# EasyEDA Pro project alcometer_v3.epro

# Schematic ESP32 Tutorial
Board Name: ESP32 Tutorial; Create Date: 2025-11-22; Page Name: Schematic; Project Name: ESP32_Alcometer_2.0; Schematic Name: ESP32 Tutorial; Update Date: 2026-02-11; Add into BOM: yes; Company: FEDEVEL; Convert to PCB: yes; Date: 2022-10-17; Draw By: robertferanec; REV: 1.0; Sheet: 1/1; spicePre: .
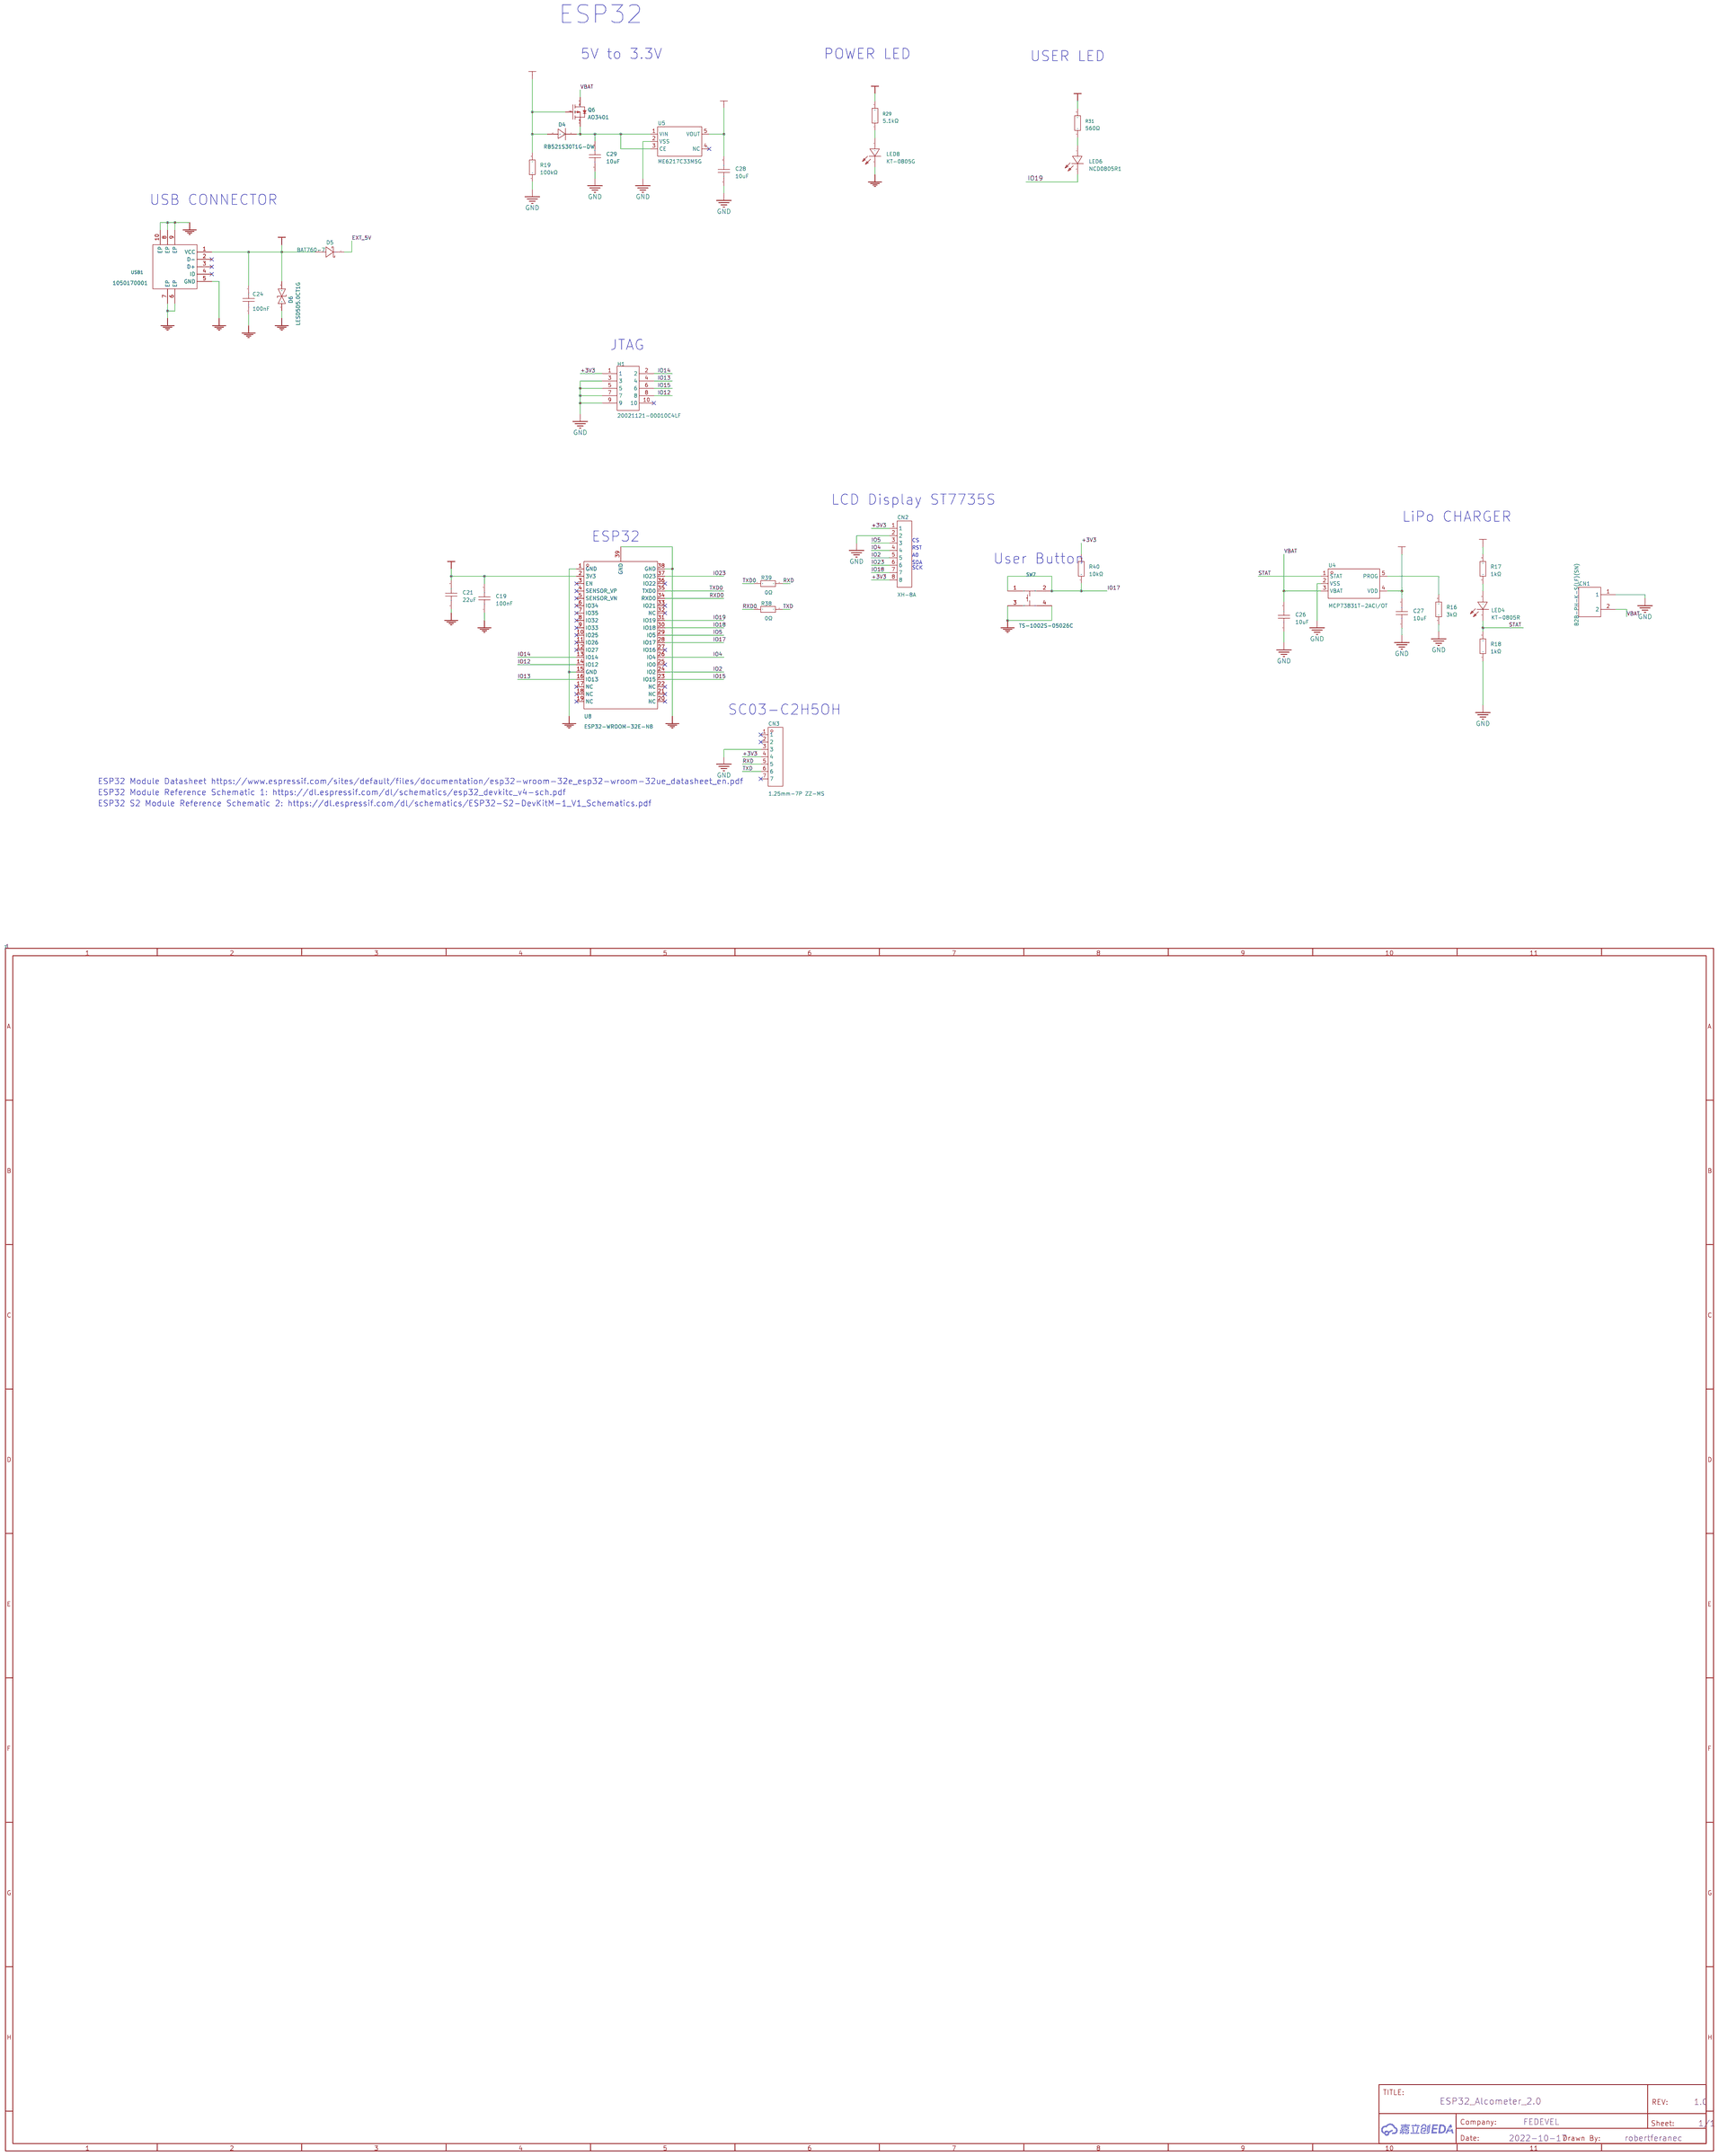
[diagram p0: schematic sheet]

## Parts
C19  100nF  [C0402]
C21  22uF  [C0805]
C24  100nF  [C0402]
C26  10uF  [C0402]
C27  10uF  [C0402]
C28  10uF  [C0402]
C29  10uF  [C0402]
CN1  B2B-PH-K-S(LF)(SN)  [CONN-TH_B2B-PH-K-S]
CN2  XH-8A  [CONN-TH_8P-P2.50_HCTL_XH-8A_C53055484]
CN3  1.25mm-7P ZZ-MS  [CONN-TH_7P-P1.25_1.25MM-7P-ZZ-MS]
D4  RB521S30T1G-DW  [SOD-523_L1.2-W0.8-LS1.6-RD]
D5  BAT760-7  [SOD-323_L1.7-W1.3-LS2.6-FD-1]
D6  LESD5D5.0CT1G  [SOD-523_L1.2-W0.8-LS1.6-BI]
H1  20021121-00010C4LF  [HDR-SMD_10P-P1.27-V-M-R2-C5-S1.27-LS5.5]
LED4  KT-0805R  [LED0805-R-RD]
LED6  NCD0805R1  [LED0805-R-RD]
LED8  KT-0805G  [LED0805-R-RD]
Q6  AO3401  [SOT-23-3_L2.9-W1.3-P0.95-LS2.4-BR]
R16  3kΩ  [R0603]
R17  1kΩ  [R0603]
R18  1kΩ  [R0603]
R19  100kΩ  [R0603]
R29  5.1kΩ  [R0402]
R31  560Ω  [R0402]
R38  0Ω  [R0603]
R39  0Ω  [R0603]
R40  10kΩ  [R0603]
SW7  TS-1002S-05026C  [KEY-SMD_4P-L6.0-W6.0-P4.50-LS9.0]
U4  MCP73831T-2ACI/OT  [SOT-23-5_L3.0-W1.7-P0.95-LS2.8-BL]
U5  ME6217C33M5G  [SOT-23-5_L3.0-W1.7-P0.95-LS2.8-BR]
U8  ESP32-WROOM-32E-N8  [WIFI-SMD_ESP32-WROOM-32E]
USB1  1050170001  [MICRO-USB-SMD_105017-0001]

## Library data of the parts
C19 C24 = CL05B104KO5NNNC: Capacitance:100nF Tolerance:±10% Tolerance:±10% Voltage Rating:16V Temperature Coefficient:X7R; LCSC Part Name: 100nF ±10% 16V; Supplier Part: C1525; Manufacturer: SAMSUNG(三星); Supplier Footprint: 0402; JLCPCB Part Class: Basic Part; Datasheet: https://item.szlcsc.com/datasheet/CL05B104KO5NNNC/1877.html; Supplier: LCSC; Tolerance: ±10%; Voltage Rating: 16V; Temperature Coefficient: X7R
C21 = CL21A226MAYNNNE: Capacitance:22uF Tolerance:±20% Tolerance:±20% Voltage Rating:25V Temperature Coefficient:X5R; LCSC Part Name: 22uF ±20% 25V; Supplier Part: C602037; Manufacturer: SAMSUNG(三星); Supplier Footprint: 0805; JLCPCB Part Class: Extended Part; Datasheet: https://item.szlcsc.com/datasheet/CL21A226MAYNNNE/631473.html; Supplier: LCSC; Tolerance: ±20%; Voltage Rating: 25V; Temperature Coefficient: X5R
C26-C29 = CL05A106MP5NUNC_C315248: Capacitance:10uF Tolerance:±20% Tolerance:±20% Voltage Rating:10V Temperature Coefficient:X5R; LCSC Part Name: 10uF ±20% 10V; Supplier Part: C315248; Manufacturer: SAMSUNG(三星); Manufacturer Part: CL05A106MP5NUNC; Supplier Footprint: 0402; JLCPCB Part Class: Extended Part; Datasheet: https://item.szlcsc.com/datasheet/CL05A106MP5NUNC/297154.html; Supplier: LCSC; Tolerance: ±20%; Voltage Rating: 10V; Temperature Coefficient: X5R
CN1 = B2B-PH-K-S(LF)(SN): Pins Structure:1x2P Pitch:2mm Mounting Type:Direct Insert Reference Series:PH Number of Pins:2P Number of Rows:1 Number of PINs Per Row:2 Row Spacing:- Current Rating:2A Contact Material:Brass Contact Plating:Tin Operating Temperature:-25℃~+85℃ Operating; LCSC Part Name: 1x2P 间距:2mm 直插 系列:PH; Supplier Part: C131337; Manufacturer: JST; Supplier Footprint: 插件,P=2mm; JLCPCB Part Class: Extended Part; Datasheet: https://atta.szlcsc.com/upload/public/pdf/source/20171026/C131342_15089839687311058815.pdf; Supplier: LCSC; Pins Structure: 1x2P; Pitch: 2mm; Mounting Type: Direct Insert; Reference Series: PH; Number of Pins: 2P; Number of Rows: 1; Number of PINs Per Row: 2; Current Rating: 2A; Contact Material: Brass; Contact Plating: Tin; Operating Temperature: -25℃~+85℃; Voltage Rating: 100V; Plastic Material: PA66; Flame Retardant Rating: UL94V-0; Supplementary Features: K-leg punch; Color: White; Z-Height of the Board: 6mm; X-Length of Bottom Edge on Board (Spacing Line): 5.9mm; Y-Width of Bottom Edge on Board: 4.5mm
CN2 = XH-8A_1: Pins Structure:1x8P Pitch:2.54mm Mounting Type:Through Hole Reference Series:XH Number of Pins:8P; LCSC Part Name: 1x8P 间距:2.54mm 直插 系列:XH; Supplier Part: C53055484; Manufacturer: LXWCONN(连兴旺电子); Supplier Footprint: 插件,P=2.5mm; JLCPCB Part Class: Extended Part; Datasheet: https://item.szlcsc.com/datasheet/XH-8A/55999684.html; Supplier: LCSC; Pins Structure: 1x8P; Pitch: 2.54mm; Mounting Type: Through Hole; Reference Series: XH; Number of Pins: 8P
CN3 = 1.25mm-7P ZZ-MS: Pins Structure:1x7P Pitch:1.25mm Mounting Type:Direct Insert Reference Series:PicoBlade(MX 1.25) Number of Pins:7P Number of Rows:1 Number of PINs Per Row:7 Row Spacing:- Current Rating:1A Contact Material:Brass Contact Plating:Tin Operating Temperature:-; LCSC Part Name: 1x7P 间距:1.25mm 直插 系列:PicoBlade(MX 1.25); Supplier Part: C5368710; Manufacturer: SHOU HAN(首韩); Supplier Footprint: 插件,P=1.25mm; JLCPCB Part Class: Extended Part; Supplier: LCSC; Pins Structure: 1x7P; Pitch: 1.25mm; Mounting Type: Direct Insert; Reference Series: PicoBlade(MX 1.25); Number of Pins: 7P; Number of Rows: 1; Number of PINs Per Row: 7; Current Rating: 1A; Contact Material: Brass; Contact Plating: Tin; Operating Temperature: -25℃~+85℃; Voltage Rating: 125V; Plastic Material: PA6T; Flame Retardant Rating: UL94V-0; Color: Beige
D4 = RB521S30T1G_C27636108: Diode Configuration:1 Independent Voltage - Forward(Vf@If):500mV@200mA Voltage - DC Reverse(Vr):30V Current - Rectified:200mA Reverse Leakage Current (Ir):30uA@10V Non-Repetitive Peak Forward Surge Current:1A; LCSC Part Name: 电压:30V 电流:0.2A; Supplier Part: C27636108; Manufacturer: DOWO(东沃); Supplier Footprint: SOD-523; JLCPCB Part Class: Extended Part; Datasheet: https://item.szlcsc.com/datasheet/RB521S30T1G-DW/29373143.html; Supplier: LCSC; Diode Configuration: 1 Independent; Voltage - Forward(Vf@If): 500mV@200mA; Voltage - DC Reverse(Vr): 30V; Current - Rectified: 200mA; Reverse Leakage Current (Ir): 30uA@10V; Non-Repetitive Peak Forward Surge Current: 1A
D5 = BAT760-7_C27636120: Voltage - Forward(Vf@If):875mV@3.0A Voltage - DC Reverse(Vr):30V Current - Rectified:1A Reverse Leakage Current (Ir):1mA@30V Non-Repetitive Peak Forward Surge Current:9A; Supplier Part: C27636120; Manufacturer: DOWO(东沃); Supplier Footprint: SOD-323; JLCPCB Part Class: Extended Part; Datasheet: https://item.szlcsc.com/datasheet/BAT760-7/29373155.html; Supplier: LCSC; Voltage - Forward(Vf@If): 875mV@3.0A; Voltage - DC Reverse(Vr): 30V; Current - Rectified: 1A; Reverse Leakage Current (Ir): 1mA@30V; Non-Repetitive Peak Forward Surge Current: 9A
D6 = LESD5D5.0CT1G: Polarity:Bidirectional Reverse Stand-Off Voltage (Vrwm):5V Clamping Voltage:18.6V Peak Pulse Current (Ipp):9.4A@8/20us Peak Pulse Power Dissipation (Ppp):150W@8/20us Voltage - Breakdown:7.8V Reverse Leakage Current (Ir):1uA Operating Temperature:-40℃~+125; LCSC Part Name: 双向ESD; Supplier Part: C383211; Manufacturer: LRC(乐山无线电); Supplier Footprint: SOD-523; JLCPCB Part Class: Extended Part; Datasheet: https://item.szlcsc.com/datasheet/LESD5D5.0CT1G/356518.html; Supplier: LCSC; Polarity: Bidirectional; Reverse Stand-Off Voltage (Vrwm): 5V; Clamping Voltage: 18.6V; Peak Pulse Current (Ipp): 9.4A@8/20us; Peak Pulse Power Dissipation (Ppp): 150W@8/20us; Voltage - Breakdown: 7.8V; Reverse Leakage Current (Ir): 1uA; Operating Temperature: -40℃~+125℃; level of protection: IEC 61000-4-4；IEC 61000-4-2; Type: ESD; Junction Capacitance: 15pF
H1 = 20021121-00010C4LF: Pin Structure:2x5P Pitch:1.27mm Row Spacing:1.27mm Circluar Pins/Square Pins:Pin Header Mounting Type:Surface Mount,Vertical Number of Rows:2 Number of Pins:10P Current Rating:- Voltage Rating (Max):- Length of Mating Pin:3.05mm Insulation Height:- Contac; LCSC Part Name: 2x5P 间距:1.27mm 方针 立贴; Supplier Part: C150517; Manufacturer: Amphenol; Supplier Footprint: SMD,P=1.27mm; JLCPCB Part Class: Extended Part; Datasheet: https://item.szlcsc.com/datasheet/20021121-00010C4LF/161855.html; Supplier: LCSC; Pin Structure: 2x5P; Pitch: 1.27mm; Row Spacing: 1.27mm; Circluar Pins/Square Pins: Pin Header; Mounting Type: Surface Mount,Vertical; Number of Rows: 2; Number of Pins: 10P; Length of Mating Pin: 3.05mm; Contact Material: Copper Alloy; Color: Black; Supplementary Features: 带柱
LED4 = KT-0805R: LCSC Part Name: 0805 红灯 高亮; Supplier Part: C2295; Manufacturer: KENTO; Supplier Footprint: 0805; JLCPCB Part Class: Extended Part; Supplier: LCSC
LED6 = NCD0805R1_C84256: Lamp Holder Type:- Emitted Color:Red Forward Voltage (VF):1.6V~2.6V Forward Voltage (VF):1.6V~2.6V Power Dissipation:65mW Forward Current:20mA Dominant Wavelength:615nm~630nm Dominant Wavelength:615nm~630nm Peak Wavelength:- Diode Configuration:独立二极管 Lens; Supplier Part: C84256; Manufacturer: 国星光电; Supplier Footprint: 0805; JLCPCB Part Class: Basic Part; Datasheet: https://atta.szlcsc.com/upload/public/pdf/source/20200820/C84256_F0A75A43B3EAD75808600A0514C76B99.pdf; Supplier: LCSC; Emitted Color: Red; Forward Voltage (VF): 1.6V~2.6V; Power Dissipation: 65mW; Forward Current: 20mA; Dominant Wavelength: 615nm~630nm; Diode Configuration: 独立二极管; Lens Color: 无色透明透镜; Luminous Intensity: 67mcd~195mcd; Viewing Angle: 130°; Operating Temperature: -30℃~+85℃
LED8 = KT-0805G: Lamp Holder Type:- Emitted Color:Emerald Forward Voltage (VF):- Forward Voltage (VF):- Power Dissipation:- Forward Current:- Dominant Wavelength:- Dominant Wavelength:- Peak Wavelength:- Diode Configuration:- Lens Color:- Color Temperature:- Color Tempera; LCSC Part Name: 0805 翠绿 高亮; Supplier Part: C2297; Manufacturer: KENTO; Supplier Footprint: 0805; JLCPCB Part Class: Basic Part; Datasheet: https://atta.szlcsc.com/upload/public/pdf/source/20170209/1486607340485.pdf; Supplier: LCSC; Emitted Color: Emerald
Q6 = AO3401_C2985640: Type:1 piece P-channel Drain to Source Voltage:30V Current - Continuous Drain(Id): RDS(on):60mΩ@10V Pd - Power Dissipation:1.4W Gate Threshold Voltage (Vgs(th)@Id):600mV Gate Charge(Qg):14nC@10V Input Capacitance(Ciss@Vds):645pF Reverse Transfer Capacitan; LCSC Part Name: P沟道,电流:-4.1A,耐压:-30V; Supplier Part: C2985640; Manufacturer: KUU; Supplier Footprint: SOT-23; JLCPCB Part Class: Extended Part; Datasheet: https://atta.szlcsc.com/upload/public/pdf/source/20220328/37BE275F20EB9DF71D2647772B9E905B.pdf; Supplier: LCSC; Type: 1 piece P-channel; Drain to Source Voltage: 30V; RDS(on): 60mΩ@10V; Pd - Power Dissipation: 1.4W; Gate Threshold Voltage (Vgs(th)@Id): 600mV; Gate Charge(Qg): 14nC@10V; Input Capacitance(Ciss@Vds): 645pF; Reverse Transfer Capacitance (Crss@Vds): 55pF; Operating Temperature: -55℃~+150℃
R16 = 0603WAF3001T5E: Type:Thick Film Resistor Resistance:3kΩ Tolerance:±1% Tolerance:±1% Power(Watts):100mW Voltage-Supply(Max):75V Temperature Coefficient:±100ppm/℃ Temperature Coefficient:±100ppm/℃ Operating Temperature:-55℃~+155℃ Operating Temperature:-55℃~+155℃; LCSC Part Name: 3kΩ ±1% 100mW 厚膜电阻; Supplier Part: C4211; Manufacturer: UNI-ROYAL(厚声); Supplier Footprint: 0603; JLCPCB Part Class: Basic Part; Datasheet: https://item.szlcsc.com/datasheet/0603WAF3001T5E/4618.html; Supplier: LCSC; Type: Thick Film Resistor; Tolerance: ±1%; Power(Watts): 100mW; Voltage-Supply(Max): 75V; Temperature Coefficient: ±100ppm/℃; Operating Temperature: -55℃~+155℃
R17 R18 = RC0603FR-071KL: Type:Thick Film Resistor Resistance:1kΩ Tolerance:±1% Tolerance:±1% Power(Watts):100mW Voltage-Supply(Max):75V Temperature Coefficient:±100ppm/℃ Temperature Coefficient:±100ppm/℃ Operating Temperature:-55℃~+155℃ Operating Temperature:-55℃~+155℃; LCSC Part Name: 厚膜电阻 1kΩ ±1% 100mW; Supplier Part: C22548; Manufacturer: YAGEO(国巨); Supplier Footprint: 0603; JLCPCB Part Class: Extended Part; Datasheet: https://atta.szlcsc.com/upload/public/pdf/source/20180316/70C0E2BDAE7FCC62C531A5A58D202EE1.pdf; Supplier: LCSC; Type: Thick Film Resistors; Tolerance: ±1%; Power(Watts): 100mW; Voltage-Supply(Max): 75V; Temperature Coefficient: ±100ppm/℃; Operating Temperature: -55℃~+155℃
R19 = 0603WAF1003T5E: Type:Thick Film Resistor Resistance:100kΩ Tolerance:±1% Tolerance:±1% Power(Watts):100mW Voltage-Supply(Max):75V Temperature Coefficient:±100ppm/℃ Temperature Coefficient:±100ppm/℃ Operating Temperature:-55℃~+155℃ Operating Temperature:-55℃~+155℃; LCSC Part Name: 100kΩ ±1% 100mW 厚膜电阻; Supplier Part: C25803; Manufacturer: UNI-ROYAL(厚声); Supplier Footprint: 0603; JLCPCB Part Class: Basic Part; Datasheet: https://item.szlcsc.com/datasheet/0603WAF1003T5E/26546.html; Supplier: LCSC; Type: Thick Film Resistor; Tolerance: ±1%; Power(Watts): 100mW; Voltage-Supply(Max): 75V; Temperature Coefficient: ±100ppm/℃; Operating Temperature: -55℃~+155℃
R29 = 0402WGF5101TCE: Type:Thick Film Resistor Resistance:5.1kΩ Tolerance:±1% Tolerance:±1% Power(Watts):62.5mW Voltage-Supply(Max):50V Temperature Coefficient:±100ppm/℃ Temperature Coefficient:±100ppm/℃ Operating Temperature:-55℃~+155℃ Operating Temperature:-55℃~+155℃; LCSC Part Name: 5.1kΩ ±1% 62.5mW 厚膜电阻; Supplier Part: C25905; Manufacturer: UNI-ROYAL(厚声); Supplier Footprint: 0402; JLCPCB Part Class: Basic Part; Datasheet: https://item.szlcsc.com/datasheet/0402WGF5101TCE/26648.html; Supplier: LCSC; Type: Thick Film Resistor; Tolerance: ±1%; Power(Watts): 62.5mW; Voltage-Supply(Max): 50V; Temperature Coefficient: ±100ppm/℃; Operating Temperature: -55℃~+155℃
R31 = 0402WGF5600TCE: Type:Thick Film Resistor Resistance:560Ω Tolerance:±1% Tolerance:±1% Power(Watts):62.5mW Voltage-Supply(Max):50V Temperature Coefficient:±100ppm/℃ Temperature Coefficient:±100ppm/℃ Operating Temperature:-55℃~+155℃ Operating Temperature:-55℃~+155℃; LCSC Part Name: 560Ω ±1% 62.5mW 厚膜电阻; Supplier Part: C25126; Manufacturer: UNI-ROYAL(厚声); Supplier Footprint: 0402; JLCPCB Part Class: Extended Part; Datasheet: https://item.szlcsc.com/datasheet/0402WGF5600TCE/25869.html; Supplier: LCSC; Type: Thick Film Resistor; Tolerance: ±1%; Power(Watts): 62.5mW; Voltage-Supply(Max): 50V; Temperature Coefficient: ±100ppm/℃; Operating Temperature: -55℃~+155℃
R38 R39 = 0603WAF0000T5E: Type:Thick Film Resistor Resistance:0Ω Tolerance:±1% Tolerance:±1% Power(Watts):100mW Voltage-Supply(Max):75V Temperature Coefficient:- Temperature Coefficient:- Operating Temperature:-55℃~+155℃ Operating Temperature:-55℃~+155℃; LCSC Part Name: 0Ω ±1% 100mW 厚膜电阻; Supplier Part: C21189; Manufacturer: UNI-ROYAL(厚声); Supplier Footprint: 0603; JLCPCB Part Class: Basic Part; Datasheet: https://item.szlcsc.com/datasheet/0603WAF0000T5E/21903.html; Supplier: LCSC; Type: Thick Film Resistor; Tolerance: ±1%; Power(Watts): 100mW; Voltage-Supply(Max): 75V; Operating Temperature: -55℃~+155℃
R40 = RC0603FR-0710KL: Type:Thick Film Resistors Resistance: Tolerance:±1% Tolerance:±1% Power(Watts): Overload Voltage (Max): Temperature Coefficient:±100ppm/℃ Temperature Coefficient:±100ppm/℃ Operating Temperature Range:-55℃~+155℃ Operating Temperature Range:-55℃~+155℃; LCSC Part Name: 厚膜电阻 10kΩ ±1% 100mW; Supplier Part: C98220; Manufacturer: YAGEO(国巨); Supplier Footprint: 0603; JLCPCB Part Class: Extended Part; Datasheet: https://atta.szlcsc.com/upload/public/pdf/source/20180927/C295883_E8D83085EA81BD7DE0B2B681138C15EE.pdf; Supplier: LCSC; Type: Thick Film Resistors; Tolerance: ±1%; Temperature Coefficient: ±100ppm/℃; Operating Temperature Range: -55℃~+155℃
SW7 = TS-1002S-05026C: Circuit:SPST Actuator Style:Round Button Mounting Type:Vertical welding Length:6mm Width:6mm Switch Height:5mm Contact Current:50mA Voltage Rating:12V With Lamp:- Life:-; LCSC Part Name: 6*6*5mm 立贴 轻触开关; Supplier Part: C455110; Manufacturer: XUNPU(讯普); Supplier Footprint: SMD,6x6mm; JLCPCB Part Class: Extended Part; Datasheet: https://atta.szlcsc.com/upload/public/pdf/source/20250513/F8F0C18C3D0EDC07DAC80A3CC3CDA783.pdf; Supplier: LCSC; Circuit: SPST; Actuator Style: Round Button; Mounting Type: Vertical welding; Length: 6mm; Width: 6mm; Switch Height: 5mm; Contact Current: 50mA; Voltage Rating: 12V
U4 = MCP73831T-2ACI/OT: The Chip Type:- Voltage - Supply:3.75V~6V Voltage - Supply:3.75V~6V Charge Current - Max:- Charging Saturation Voltage:4.2V Type of Battery:Lithium-ion/Polymer Number of Cells:1 Number of Cells:1 Operating Temperature:-40℃~+85℃ Operating Temperature:-40℃~; Supplier Part: C424093; Manufacturer: MICROCHIP(美国微芯); Supplier Footprint: SOT-23-5; JLCPCB Part Class: Extended Part; Datasheet: https://atta.szlcsc.com/upload/public/pdf/source/20190902/C424093_BB3CBFD6F009A8554318004A07DA97EE.pdf; Supplier: LCSC; Voltage - Supply: 3.75V~6V; Charging Saturation Voltage: 4.2V; Type of Battery: Lithium-ion/Polymer; Number of Cells: 1; Operating Temperature: -40℃~+85℃
U5 = ME6217C33M5G: Output Type:Fixed Voltage - Supply:6.5V Output Voltage:3.3V Output Voltage:3.3V Output Current:800mA Power Supply Rejection Ratio (PSRR):65dB@(1kHz) Voltage Dropout:180mV@(300mA) standby current:100uA Features:Over Temperature Protection；Enable Operating; LCSC Part Name: 输入7V 输出3.3V 800mA; Supplier Part: C427602; Manufacturer: MICRONE(南京微盟); Supplier Footprint: SOT-23-5; JLCPCB Part Class: Extended Part; Datasheet: https://atta.szlcsc.com/upload/public/pdf/source/20190910/C427602_D4B9162A2E9D9EF57C60010DFDECEF37.pdf; Supplier: LCSC; Output Type: Fixed; Voltage - Supply: 6.5V; Output Voltage: 3.3V; Output Current: 800mA; Power Supply Rejection Ratio (PSRR): 65dB@(1kHz); Voltage Dropout: 180mV@(300mA); standby current: 100uA; Features: Over Temperature Protection；Enable; Operating Temperature: -40℃~+85℃; Output Configuration: Positive; Number of Outputs: 1
U8 = ESP32-WROOM-32E-N8: LCSC Part Name: 通用型Wi-Fi+BT+BLE MCU模组; Supplier Part: C701342; Manufacturer: ESPRESSIF(乐鑫); Supplier Footprint: SMD,18x25.5mm; JLCPCB Part Class: Extended Part; Datasheet: https://atta.szlcsc.com/upload/public/pdf/source/20240307/DEBA00FAE5BA634F0D73085E4F214E93.pdf; Supplier: LCSC
USB1 = 1050170001: Connector Type:Micro-B Standard:USB 2.0 Gender:Female Number of Ports:1 Number of Contacts:5P Mounting Style:卧贴 Current Rating - Power (Max):- Operating Temperature Range:-30℃~+85℃ Operating Temperature Range:-30℃~+85℃; LCSC Part Name: Micro-B 母 卧贴; Supplier Part: C136000; Manufacturer: MOLEX; Supplier Footprint: SMD; JLCPCB Part Class: Extended Part; Datasheet: https://atta.szlcsc.com/upload/public/pdf/source/20171113/C136000_15105610884381115465.pdf; Supplier: LCSC; Connector Type: Micro-B; Standard: USB 2.0; Gender: Female; Number of Ports: 1; Number of Contacts: 5P; Mounting Style: 卧贴; Operating Temperature Range: -30℃~+85℃

## Nets
+3V3: C19.2 C21.2 C28.2 CN2.1 CN2.8 CN3.4 H1.1 R29.2 R31.2 R40.2 U5.5(VOUT) U8.2(3V3)
+5V_VBUS: C24.2 D5.2(A) D6.2 USB1.1(VCC)
GND: C19.1 C21.1 C24.1 C26.1 C27.1 C28.1 C29.1 CN1.1 CN2.2 CN3.3 D6.1 H1.3 H1.5 H1.7 H1.9 LED8.2(K) R16.1 R18.1 R19.1 SW7.3 SW7.4 U4.2(VSS) U5.2(VSS) U8.1(GND) U8.15(GND) U8.38(GND) U8.39(GND) USB1.5(GND) USB1.6(EP) USB1.7(EP) USB1.8(EP) USB1.9(EP) USB1.10(EP)
VBAT: C26.2 CN1.2 Q6.3(D) U4.3(VBAT)
EXT_5V: C27.2 D4.2(A) D5.1(C) Q6.1(G) R17.2 R19.2 U4.4(VDD)
IO2: CN2.5 U8.24(IO2)
IO4: CN2.4 U8.26(IO4)
IO5: CN2.3 U8.29(IO5)
IO12: H1.8 U8.14(IO12)
IO13: H1.4 U8.16(IO13)
IO14: H1.2 U8.13(IO14)
IO15: H1.6 U8.23(IO15)
IO17: R40.1 SW7.1 SW7.2 U8.28(IO17)
IO18: CN2.7 U8.30(IO18)
IO19: LED6.2(-) U8.31(IO19)
IO23: CN2.6 U8.37(IO23)
RXD: CN3.5 R39.2
RXD0: R38.1 U8.34(RXD0)
STAT: LED4.2(K) R18.2 U4.1(STAT)
TXD: CN3.6 R38.2
TXD0: R39.1 U8.35(TXD0)
Net-(C29-2): C29.2 D4.1(C) Q6.2(S) U5.1(VIN) U5.3(CE)
Net-(LED4-1): LED4.1(A) R17.1
Net-(LED6-1): LED6.1(+) R31.1
Net-(LED8-1): LED8.1(A) R29.1
Net-(R16-2): R16.2 U4.5(PROG)

Not connected (* = marked no-connect by the designer): CN3 1* 2* 7*; H1 10*; U5 4(NC)*; U8 3(EN)* 4(SENSOR_VP)* 5(SENSOR_VN)* 6(IO34)* 7(IO35)* 8(IO32)* 9(IO33)* 10(IO25)* 11(IO26)* 12(IO27)* 17(NC)* 18(NC)* 19(NC)* 20(NC)* 21(NC)* 22(NC)* 25(IO0)* 27(IO16)* 32(NC)* 33(IO21)* 36(IO22)*; USB1 2(D-)* 3(D+)* 4(ID)*

## Notes on the sheet
- ESP32
- 5V to 3.3V
- POWER LED
- USER LED
- USB CONNECTOR
- JTAG
- LCD Display ST7735S
- LiPo CHARGER
- ESP32
- CS
- RST
- A0
- SDA
- User Button
- SCK
- SC03-C2H5OH
- ESP32 Module Datasheet https://www.espressif.com/sites/default/files/documentation/esp32-wroom-32e_esp32-wroom-32ue_datasheet_en.pdf
- ESP32 Module Reference Schematic 1: https://dl.espressif.com/dl/schematics/esp32_devkitc_v4-sch.pdf
- ESP32 S2 Module Reference Schematic 2: https://dl.espressif.com/dl/schematics/ESP32-S2-DevKitM-1_V1_Schematics.pdf
